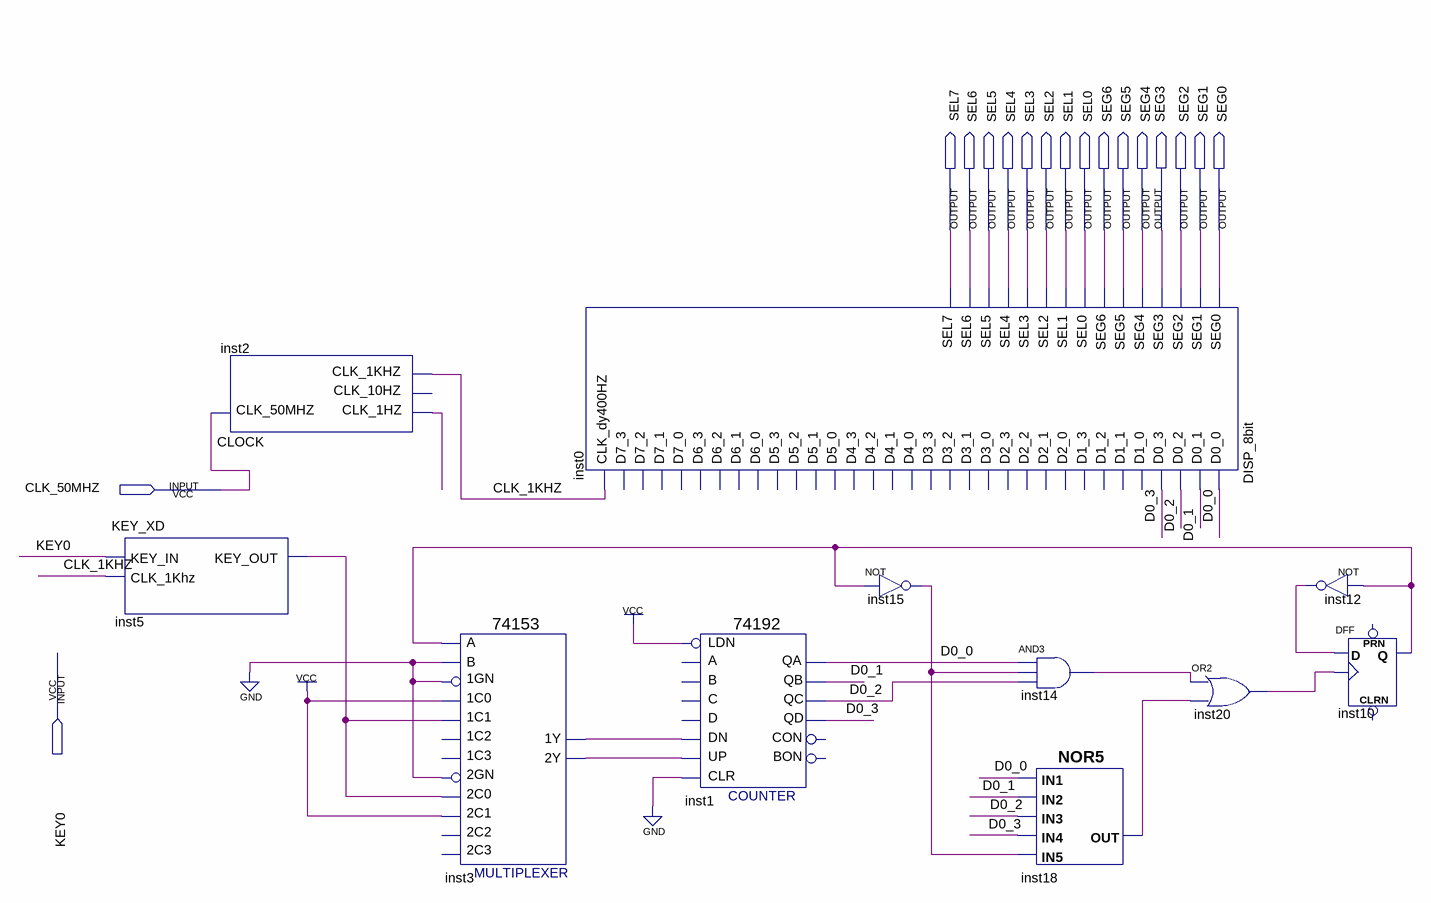
[diagram p0: schematic sheet]
// Quartus schematic KN_CONT5.bdf as structural Verilog: 11 symbols, 17 pins
module KN_CONT5 (
  input  CLK_50MHZ,
  input  KEY0,
  output SEL7,
  output SEL6,
  output SEL5,
  output SEL4,
  output SEL3,
  output SEL2,
  output SEL1,
  output SEL0,
  output SEG6,
  output SEG5,
  output SEG4,
  output SEG3,
  output SEG2,
  output SEG1,
  output SEG0
);

  wire CLK_1KHZ, D0_0, D0_1, D0_2, D0_3, inst2_clk_1hz, inst3_1y, inst3_2y, inst5_key_out, inst10_q,
       inst12_out, inst14_out, inst15_out, inst18_out, inst20_out;

  KEY_XD inst5 (.KEY_IN(KEY0), .CLK_1Khz(CLK_1KHZ), .KEY_OUT(inst5_key_out));
  CLOCK inst2 (.CLK_50MHZ(CLK_50MHZ), .CLK_1HZ(inst2_clk_1hz), .CLK_1KHZ(CLK_1KHZ));  // open: CLK_10HZ
  \74153  inst3 (
    .\1C1 (inst5_key_out), .\1GN (1'b0), .\1C0 (1'b1), .\2C0 (inst5_key_out), .\2GN (1'b0), .B(1'b0),
    .A(inst10_q), .\2C1 (1'b1), .\1Y (inst3_1y), .\2Y (inst3_2y));  // open: 2C2, 1C2, 1C3, 2C3
  DISP_8bit inst0 (
    .D0_0(D0_0), .D0_1(D0_1), .D0_2(D0_2), .D0_3(D0_3), .CLK_dy400HZ(CLK_1KHZ), .SEG0(SEG0), .SEG1(SEG1),
    .SEG2(SEG2), .SEG3(SEG3), .SEG4(SEG4), .SEG5(SEG5), .SEG6(SEG6), .SEL0(SEL0), .SEL1(SEL1), .SEL2(SEL2),
    .SEL3(SEL3), .SEL4(SEL4), .SEL5(SEL5), .SEL6(SEL6), .SEL7(SEL7));  // open: D1_0, D1_1, D1_2, D1_3, D2_0, D2_1, D2_2, D2_3, D3_0, D3_1, D3_2, D3_3, D4_0, D4_1, D4_2, D4_3, D5_0, D5_1, D5_2, D5_3, D6_0, D6_1, D6_2, D6_3, D7_0, D7_1, D7_2, D7_3
  \74192  inst1 (
    .CLR(1'b0), .UP(inst3_2y), .DN(inst3_1y), .LDN(1'b1), .QB(D0_1), .QA(D0_0), .QC(D0_2), .QD(D0_3));  // open: D, C, A, B, BON, CON
  not inst15 (inst15_out, inst10_q);
  and inst14 (inst14_out, D0_0, inst15_out, D0_2);
  nor inst18 (inst18_out, D0_0, D0_1, D0_2, D0_3, inst15_out);
  or inst20 (inst20_out, inst14_out, inst18_out);
  not inst12 (inst12_out, inst10_q);
  DFF inst10 (.CLK(inst20_out), .D(inst12_out), .Q(inst10_q));  // open: CLRN, PRN
endmodule
